# Altium schematic sheet Oscillator.SchDoc
size A4; SheetNumber: 4; SheetTotal: 4
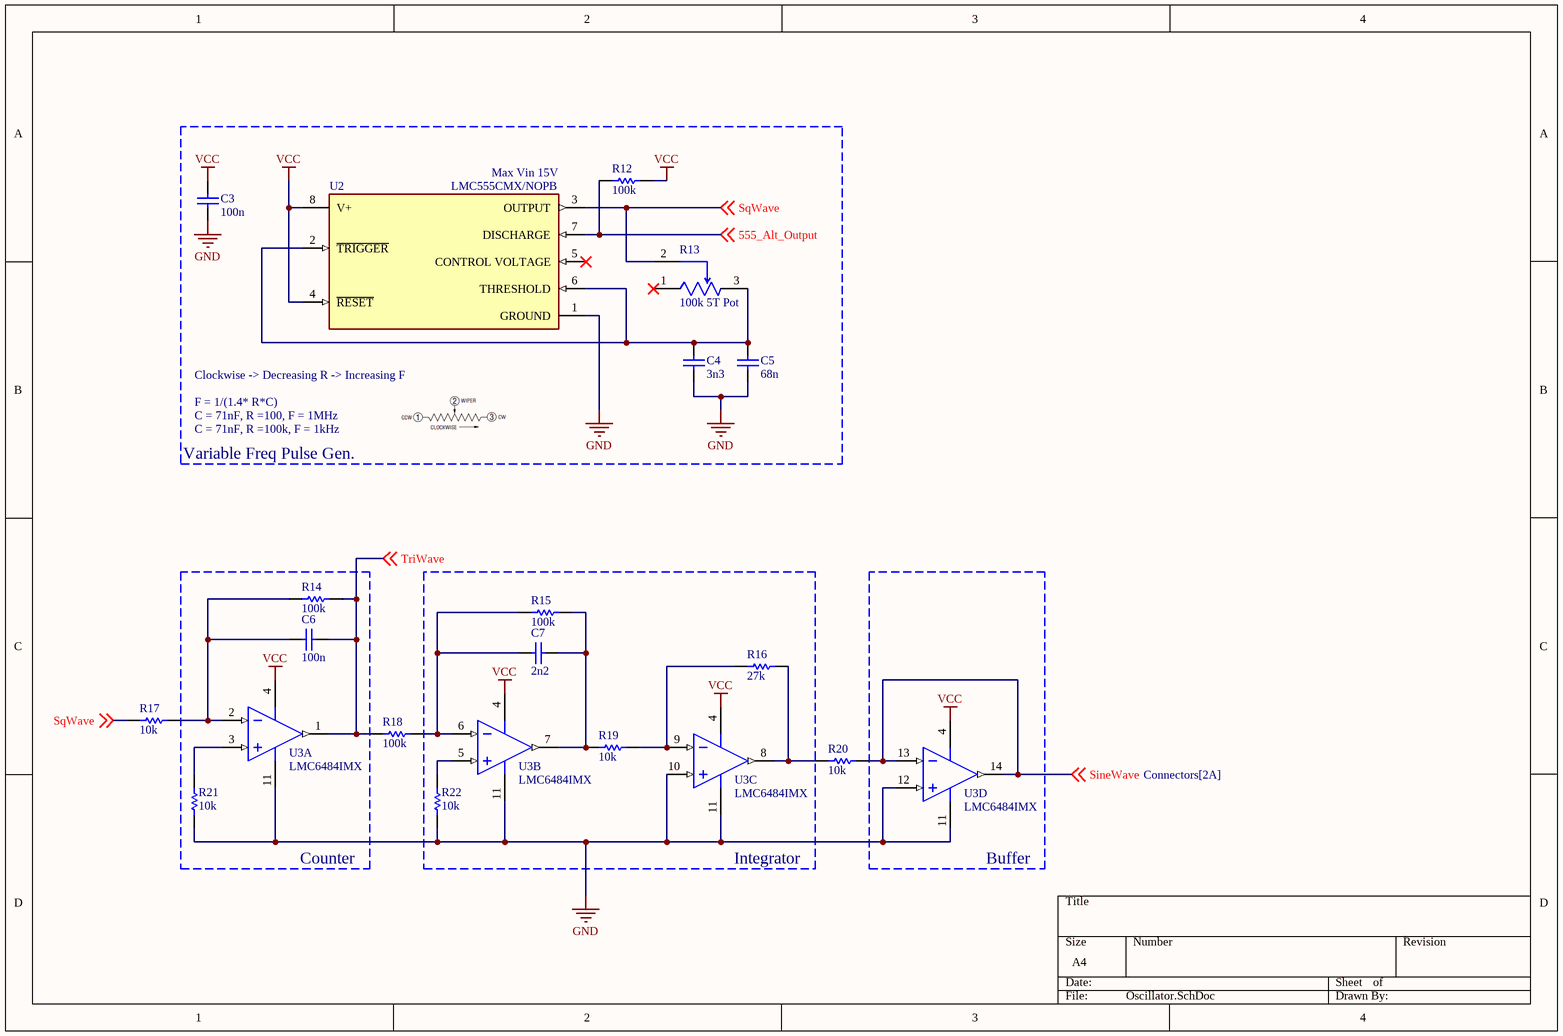
[diagram p0: Oscillator.SchDoc]

## Parts
C3  100n  [CAPC2013X145X48ML20T23]
C4  3n3  [CAPC2013X145X48ML20T23]
C5  68n  [CAPC2013X145X48ML20T23]
C6  100n  [CAPC2013X145X48ML20T23]
C7  2n2  [CAPC2013X145X48ML20T23]
R12  100k  [RESC2013X50X30ML20T20]
R13  100k 5T Pot  [FP-3214W-MFG]
R14  100k  [RESC2013X50X30ML20T20]
R15  100k  [RESC2013X50X30ML20T20]
R16  27k  [RESC2013X50X30ML20T20]
R17  10k  [RESC2013X50X30ML20T20]
R18  100k  [RESC2013X50X30ML20T20]
R19  10k  [RESC2013X50X30ML20T20]
R20  10k  [RESC2013X50X30ML20T20]
R21  10k  [RESC2013X50X30ML20T20]
R22  10k  [RESC2013X50X30ML20T20]
U2  LMC555CMX/NOPB  [FP-D0008A-MFG]
U3  LMC6484IMX  [D0014A_N]  (parts A,B,C,D of 4)

## Blocks framed on the sheet
Variable Freq Pulse Gen.: C3-C5 R12 R13 U2
Counter: C6 R14 R21 U3
Integrator: C7 R15 R16 R19 R22 U3
Buffer: U3

## Nets
GND: C3.1 C4.1 C5.1 R21.2 R22.2 U2.1(GROUND) U3.10(IN3+) U3.11(V-) U3.12(IN4+)
VCC: C3.2 R12.1 U2.4(~{RESET}) U2.8(V+) U3.4(V+)
555_Alt_Output: R12.2 U2.7(DISCHARGE) ; off-sheet 555_Alt_Output
SineWave: R20.1 U3.13(IN4-) U3.14(OUT4) ; off-sheet SineWave
SqWave: R13.2(WIPER) R17.2 U2.3(OUTPUT) ; off-sheet SqWave
TriWave: C6.1 R14.1 R18.2 U3.1(OUT1) ; off-sheet TriWave
NetC4_2: C4.2 C5.2 R13.3(CW) U2.2(~{TRIGGER}) U2.6(THRESHOLD)
NetC6_2: C6.2 R14.2 R17.1 U3.2(IN1-)
NetC7_1: C7.1 R15.1 R19.2 U3.7(OUT2)
NetC7_2: C7.2 R15.2 R18.1 U3.6(IN2-)
NetR16_1: R16.1 R20.2 U3.8(OUT3)
NetR16_2: R16.2 R19.1 U3.9(IN3-)
NetR21_1: R21.1 U3.3(IN1+)
NetR22_1: R22.1 U3.5(IN2+)

Not connected (* = marked no-connect by the designer): R13 1(CCW)*; U2 5(CONTROL_VOLTAGE)*

## Notes on the sheet
- (near U2) Max Vin 15V
- Clockwise -> Decreasing R -> Increasing F
- F = 1/(1.4* R*C)
- C = 71nF, R =100, F = 1MHz
- C = 71nF, R =100k, F = 1kHz

## Library data of the parts
C3-C7 = CMP-2007-01701-1: Manufacturer: Vitramon; Part Number: VJ0805A101KXAAC
R12 R14-R22 = CMP-2001-03596-1: Part Number: CRCW08051K00FKEB; Manufacturer: Vishay Dale
R13 = CMP-2000-05577-2: TRIMMER 10K OHM 0.25W J LEAD TOP; Manufacturer: Bourns; Manufacturer Part Number: 3214W-1-103E; Value: 10kΩ; Tolerance: 10%; Voltage Rating: 300V; Description: TRIMMER, SMD, 5 TURN 10K; Standoff Height: 0.2mm; Temperature Coefficient: 100ppm/°C; Temperature: -65°C to +150°C; Digikey Description: TRIMMER 10K OHM 0.25W J LEAD TOP; RoHS: TRUE; Mouser Description: Trimmer Resistors - SMD 4mm SQ 10K OHM; ComponentLink2URL: https://www.bourns.com/docs/product-datasheets/3214.pdf?sfvrsn=62585356_13; Automotive: No; Temperature Range High: +150°C; Device Class L2: Resistors; Device Class L3: Variable Resistors and Potentiometers; Octopart: https://octopart.com/3214w-1-103e-bourns-23348; Power Rating: 0.25W; Composition: Multiturn Cermet; Package: 3214W; Height: 5.55mm; Series: 3214; Device Class L1: Passive Components; Temperature Range Low: -65°C; Lead Free: Yes; ComponentLink2Description: Datasheet; Category: Res; Resistance: 10kΩ
U2 = CMP-04858-000001-1: IC OSC SINGLE TIMER 3MHZ 8-SOIC; Manufacturer: Texas Instruments; Description: 555 Type, Timer/Oscillator (Single) IC 3MHz 8-SOIC; Number Of Timers/Counters: 1; Max Supply Voltage: 15V; Standoff Height: 0.11mm; Propagation Delay: 100ns; Nominal Supply Current: 50-150uA; Min Supply Voltage: 1.5V; Octopart: https://octopart.com/lmc555cmx%2Fnopb-texas+instruments-24815227; Frequency: 3MHz; Device Class L2: Clock and Timing; Temperature: -40°C to +85°C; Temperature Range Low: -40°C; Height: 1.75mm; ComponentLink2URL: http://www.ti.com/general/docs/suppproductinfo.tsp?distId=10&gotoUrl=http%3A%2F%2Fwww.ti.com%2Flit%2Fgpn%2Flmc555; Package: D0008A; Device Class L1: Integrated Circuits (ICs); Manufacturer Part Number: LMC555CMX/NOPB; RoHS: TRUE; Lead Free: Yes; Temperature Range High: +85°C; Digikey Description: IC OSC SINGLE TIMER 3MHZ 8-SOIC; Device Class L3: Timers and Oscillators; ComponentLink2Description: Datasheet; Mouser Description: Timers & Support Products CMOS TIMER; Category: IC; Ipc Land Pattern Name: SOIC127P600X175-8; Automotive: No
U3 = CMP-0055-00813-3: CMOS Quad Rail to Rail Input and Output Operational Amplifier, 14-pin Narrow SOIC; Manufacturer: Texas Instruments; PackageTopMarking: NSUZXYTTE#*LMC6484IM; PowerWise: N; CompType: Amplifiers; PackageDescription: Molded Package S.O., .150in Wide, 14 Lead; Package Reference: D0014A; RoHS: N; PinCount: 14; ComponentLink1URL: http://www.ti.com/general/docs/lit/getliterature.tsp?genericPartNumber=LMC6484&fileType=pdf; ComponentLink1Description: Datasheet URL; Code_JEDEC: MS-012AB; Code_IPC: SOIC127P600-14